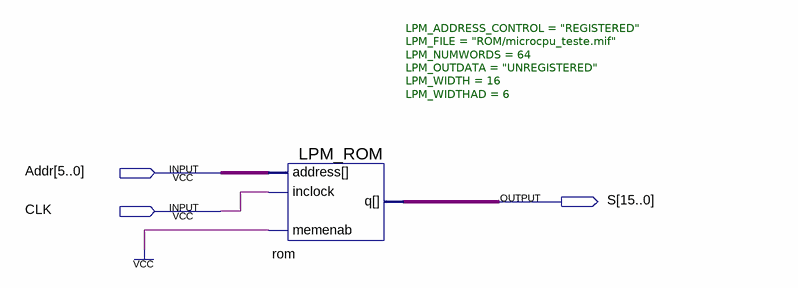
[diagram p0: schematic sheet]
// Quartus schematic rom.bdf as structural Verilog: 1 symbols, 3 pins
module rom (
  input  [5:0] Addr,
  input  CLK,
  output [15:0] S
);

  LPM_ROM #(.LPM_ADDRESS_CONTROL("REGISTERED"), .LPM_FILE("ROM/microcpu_teste.mif"), .LPM_NUMWORDS(64), .LPM_OUTDATA("UNREGISTERED"), .LPM_WIDTH(16), .LPM_WIDTHAD(6)) rom (
    .address(Addr), .inclock(CLK), .memenab(1'b1), .q(S));
endmodule
